# Altium schematic sheet EG2104_BSC011N03LSI.SchDoc: BSC011N03LSI
size A3; Revision: V1; SheetNumber: 1; SheetTotal: 1; Project: EG2104
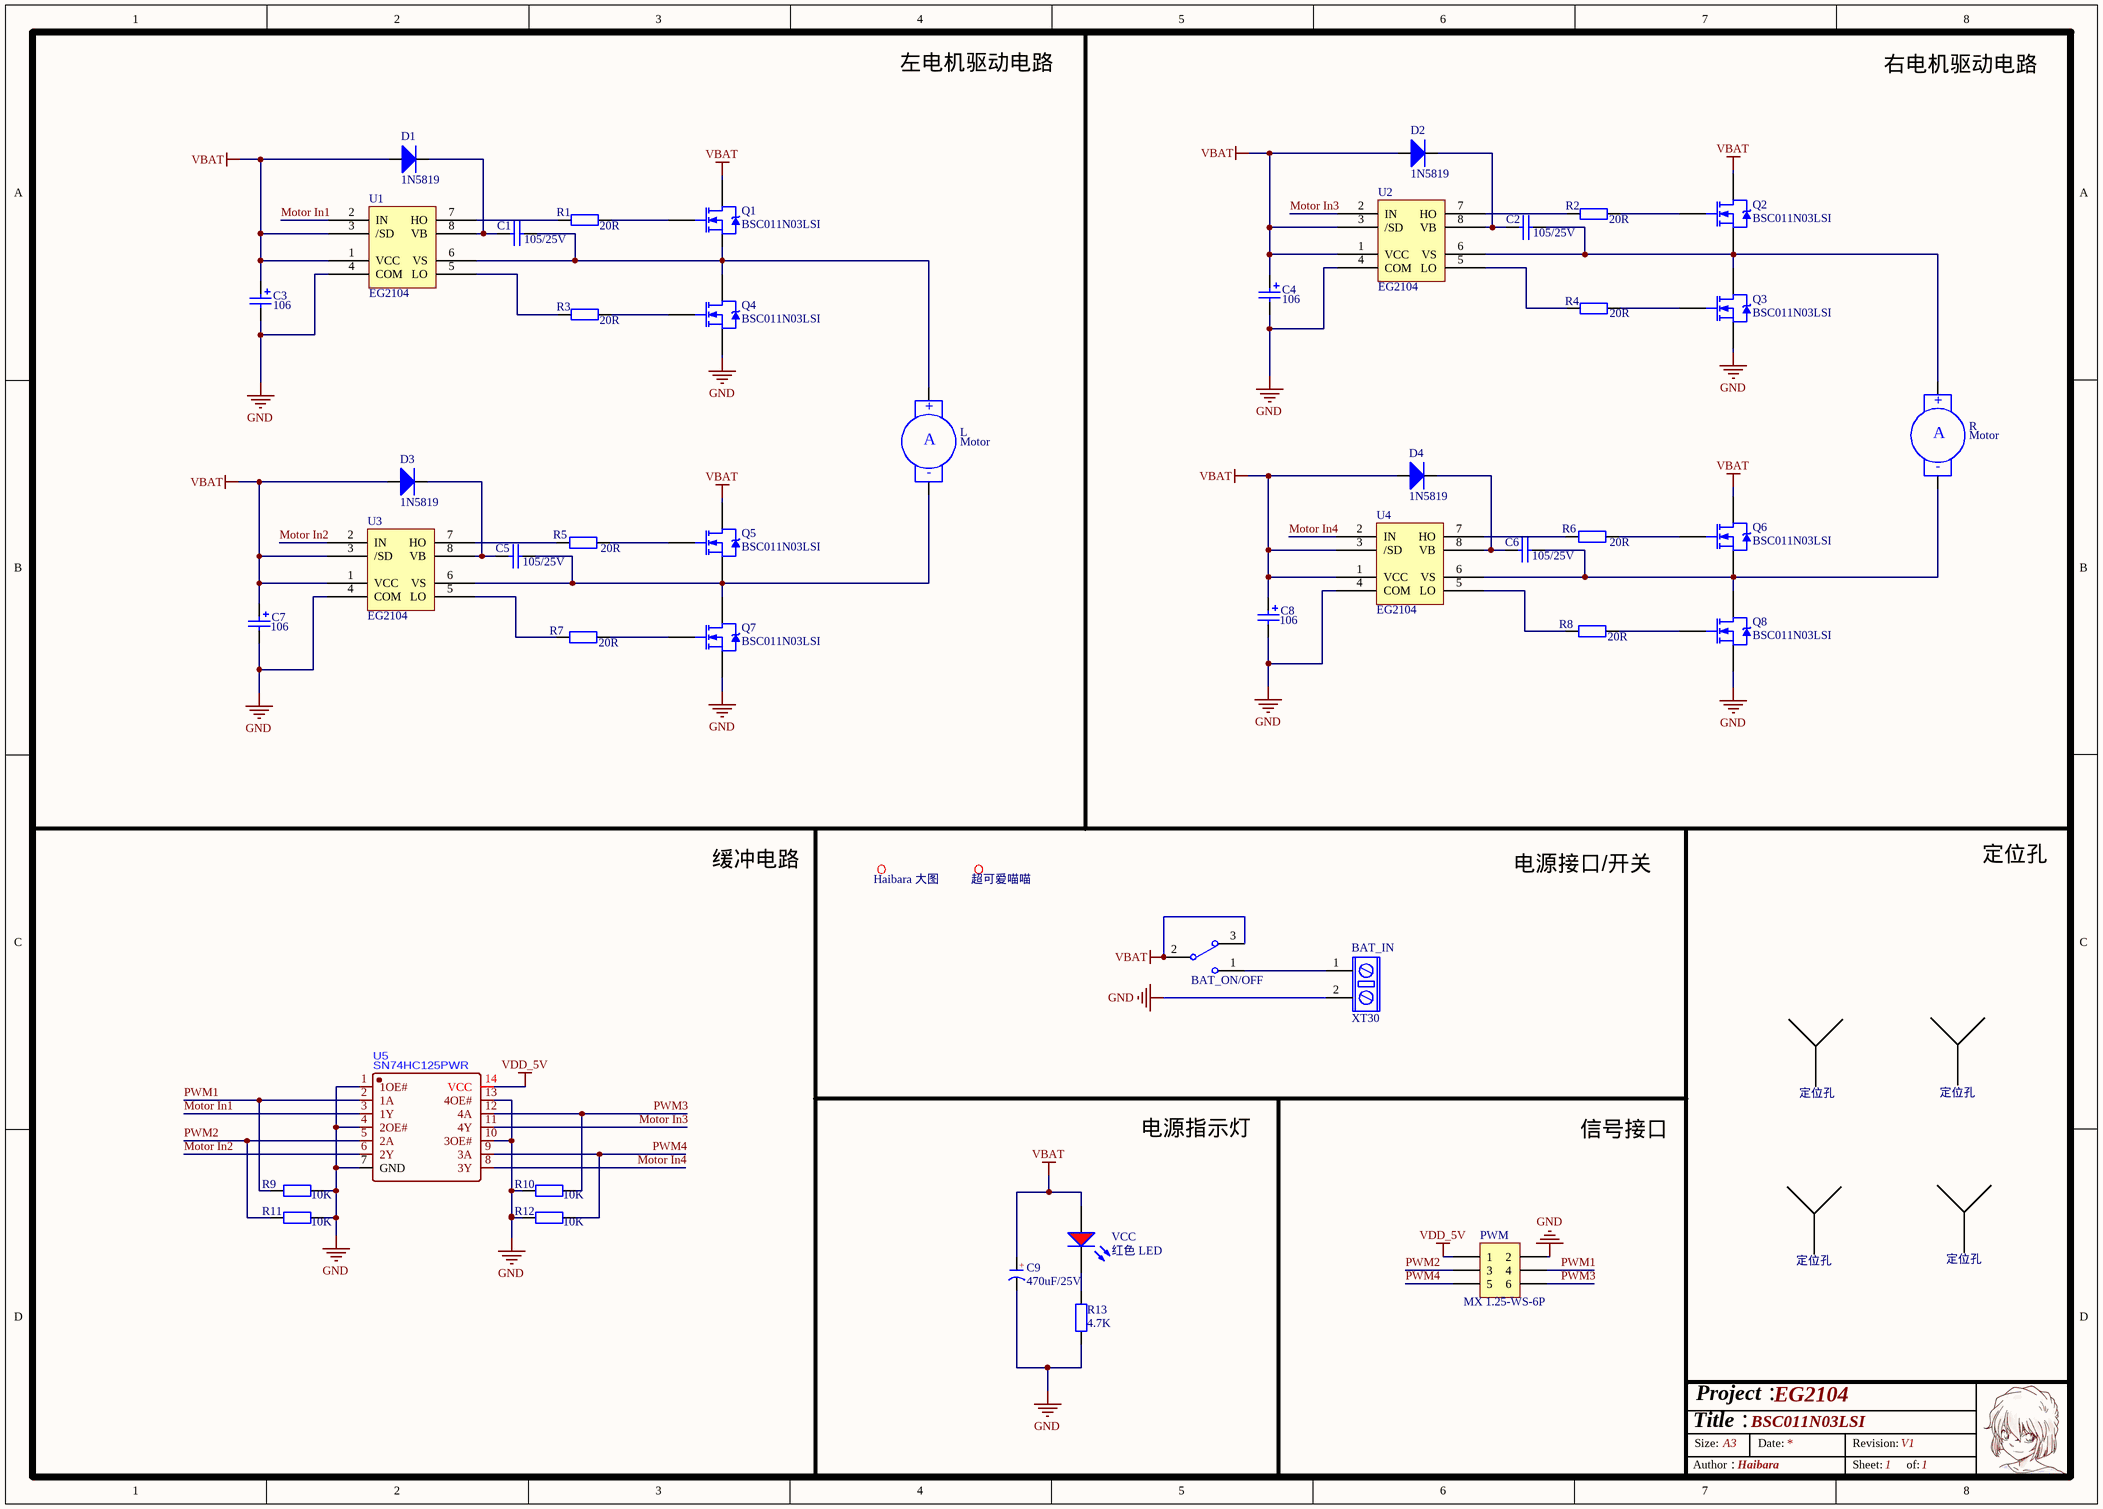
[diagram p0: EG2104_BSC011N03LSI.SchDoc]

## Parts
(Parts that share a designator on the sheet are numbered #1, #2 ... from top to bottom, then left to right.)
*1  定位孔  [MTGP720H320V6P - duplicate]
*2  定位孔  [MTGP720H320V6P - duplicate]
*3  定位孔  [MTGP720H320V6P - duplicate]
*4  定位孔  [MTGP720H320V6P - duplicate]
?#1  Haibara 大图  [Haibara大图丝印]
?#2  超可爱喵喵  [喵喵]
BAT_IN  XT30  [XT30 母头 电源插头]
BAT_ON/OFF  SW-SPDT  [MTS-102S 两档纽子开关]  (value not drawn)
C1  105/25V  [0805 电容 C3]
C2  105/25V  [0805 电容 C3]
C3  106  [0805 电容 C3]
C4  106  [0805 电容 C3]
C5  105/25V  [0805 电容 C3]
C6  105/25V  [0805 电容 C3]
C7  value 106  [0805 电容 C3]  (hidden comment: 10uF)
C8  value 106  [0805 电容 C3]  (hidden comment: 10uF)
C9  470uF/25V  [CS 5.0*10*13 - V]
D1  1N5819  [DO-214  贴片二极管]
D2  1N5819  [DO-214  贴片二极管]
D3  1N5819  [DO-214  贴片二极管]
D4  1N5819  [DO-214  贴片二极管]
L  Motor  [XT30 母头 电源插头]
PWM  MX 1.25-WS-6P  [MX 1.25-WS-6P]
Q1  BSC011N03LSI  [PSON-8 MOS]
Q2  BSC011N03LSI  [PSON-8 MOS]
Q3  BSC011N03LSI  [PSON-8 MOS]
Q4  BSC011N03LSI  [PSON-8 MOS]
Q5  BSC011N03LSI  [PSON-8 MOS]
Q6  BSC011N03LSI  [PSON-8 MOS]
Q7  BSC011N03LSI  [PSON-8 MOS]
Q8  BSC011N03LSI  [PSON-8 MOS]
R  Motor  [XT30 母头 电源插头]
R1  20R  [R0603]
R2  20R  [R0603]
R3  20R  [R0603]
R4  20R  [R0603]
R5  20R  [R0603]
R6  20R  [R0603]
R7  20R  [R0603]
R8  20R  [R0603]
R9  10K  [R0603]
R10  10K  [R0603]
R11  10K  [R0603]
R12  10K  [R0603]
R13  4.7K  [R0603]
U1  EG2104  [SO8NB]
U2  EG2104  [SO8NB]
U3  EG2104  [SO8NB]
U4  EG2104  [SO8NB]
U5  SN74HC125PWR  [TSSOP14_N]
VCC  红色 LED  [0603 LED R]

## Nets
GND: BAT_IN.2 C3.2 C4.2 C7.2 C8.2 C9.2(K) PWM.2 Q3.1(S) Q4.1(S) Q7.1(S) Q8.1(S) R9.2 R10.1 R11.2 R12.1 R13.2 U1.4(COM) U2.4(COM) U3.4(COM) U4.4(COM) U5.1(1OE#) U5.4(2OE#) U5.7(GND) U5.10(3OE#) U5.13(4OE#)
VBAT: BAT_ON/OFF.2 BAT_ON/OFF.3 C3.1 C4.1 C7.1 C8.1 C9.1(A) D1.1(A) D2.1(A) D3.1(A) D4.1(A) Q1.3(D) Q2.3(D) Q5.3(D) Q6.3(D) U1.1(VCC) U1.3(/SD) U2.1(VCC) U2.3(/SD) U3.1(VCC) U3.3(/SD) U4.1(VCC) U4.3(/SD) VCC.1
VDD_5V: PWM.1 U5.14(VCC)
Motor In1: U1.2(IN) U5.3(1Y)
Motor In2: U3.2(IN) U5.6(2Y)
Motor In3: U2.2(IN) U5.11(4Y)
Motor In4: U4.2(IN) U5.8(3Y)
PWM1: PWM.4 R9.1 U5.2(1A)
PWM2: PWM.3 R11.1 U5.5(2A)
PWM3: PWM.6 R10.2 U5.12(4A)
PWM4: PWM.5 R12.2 U5.9(3A)
NetBAT_IN_1: BAT_IN.1 BAT_ON/OFF.1
NetC1_1: C1.1 L.1(+) Q1.1(S) Q4.3(D) U1.6(VS)
NetC1_2: C1.2 D1.2(K) U1.8(VB)
NetC2_1: C2.1 Q2.1(S) Q3.3(D) R.1(+) U2.6(VS)
NetC2_2: C2.2 D2.2(K) U2.8(VB)
NetC5_1: C5.1 L.2(-) Q5.1(S) Q7.3(D) U3.6(VS)
NetC5_2: C5.2 D3.2(K) U3.8(VB)
NetC6_1: C6.1 Q6.1(S) Q8.3(D) R.2(-) U4.6(VS)
NetC6_2: C6.2 D4.2(K) U4.8(VB)
NetQ1_2: Q1.2(G) R1.2
NetQ2_2: Q2.2(G) R2.2
NetQ3_2: Q3.2(G) R4.2
NetQ4_2: Q4.2(G) R3.2
NetQ5_2: Q5.2(G) R5.2
NetQ6_2: Q6.2(G) R6.2
NetQ7_2: Q7.2(G) R7.2
NetQ8_2: Q8.2(G) R8.2
NetR1_1: R1.1 U1.7(HO)
NetR2_1: R2.1 U2.7(HO)
NetR3_1: R3.1 U1.5(LO)
NetR4_1: R4.1 U2.5(LO)
NetR5_1: R5.1 U3.7(HO)
NetR6_1: R6.1 U4.7(HO)
NetR7_1: R7.1 U3.5(LO)
NetR8_1: R8.1 U4.5(LO)
NetR13_1: R13.1 VCC.2

## Notes on the sheet
- 左电机驱动电路
- 右电机驱动电路
- 缓冲电路
- 电源接口/开关
- 定位孔
- 电源指示灯
- 信号接口
- Title：
- Size:
- Project：
- A3
- Date:
- Revision:
- Author：
- Haibara
- Sheet:
- of:
- (in symbol CE) +
- (in symbol Motor Servo) A

## Library data of the parts
BAT_IN = 电机供电接口
BAT_ON/OFF = SW-SPDT: SPDT Subminiature Toggle Switch, Right Angle Mounting, Vertical Actuation; Published: 24-Mar-1999; LatestRevisionDate: 17-Dec-2003; LatestRevisionNote: Schematic revised, PCB Footprint replaced.; DatasheetVersion: 05-Dec-2000; PackageReference: TL36WW15050; Publisher: Altium Limited; PackageDescription: Switch; 4 Leads; ComponentLink1Description: Manufacturer Link; ComponentLink1URL: http://www.apem.com
C1 C2 C5 C6 = Cap: Capacitor
C3 C4 C7 C8 = Cap Pol1: Polarized Capacitor (Radial); Published: 8-Jun-2000; LatestRevisionDate: 17-Jul-2002; LatestRevisionNote: Re-released for DXP Platform.; PackageReference: RB7.6-15; Publisher: Altium Limited; PackageDescription: Polarized Capacitor (Radial); 2 Leads
C9 = CE
D1-D4 = Diode: Default Diode; PackageVersion: Sep-1996; PackageDescription: DO-214-AB/SMC; 2 C-Bend Leads; Body 7.9 x 5.9 mm, inc. leads (LxW); Code_JEDEC: DO-214-AB
L R = Motor Servo: Servo Motor
PWM = 电机控制信号接口
Q1-Q8 = NMOS: N-Channel Power MOSFET 40V 100A 1.8mΩ; Note: Pin 2 is electrically connected to pin 4.; Published: 8-Jun-2000; LatestRevisionDate: 17-Jul-2002; LatestRevisionNote: Re-released for DXP Platform.; DatasheetVersion: PD-9.814; PackageVersion: Feb-1997; PackageReference: TO-220AB; Publisher: Altium Limited; PackageDescription: TO, Thru-Hole, Vertical, Heatsink Mounted; 3 In-Line Leads; Pitch 2.54 mm; ComponentLink1Description: Manufacturer Link; ComponentLink1URL: http://www.irf.com/
R1-R8 R13 = Res2: Resistor; Published: 8-Jun-2000; LatestRevisionDate: 17-Jul-2002; LatestRevisionNote: Re-released for DXP Platform.; PackageReference: AXIAL-0.4; Publisher: Altium Limited; PackageDescription: Axial Device, Thru-Hole; 2 Leads; 0.4 in Pin Spacing
R9-R12 = R_MPR: 5W无感水泥电阻; BOM名称: 大功率电阻; 版权归属: 封装库来自淘宝 ID：黄晶宝石; 联系售后: https://shop463601444.taobao.com
U1-U4 = IR2104S
VCC = 红灯: 发光二极管; ComponentLink1Description: 供应商链接; ComponentLink1URL: http://www.szlcsc.com/product/details_2668.html; Package: 0805; Supplier: LC; SuppliersPartNumber: C2295